# Altium schematic sheet i_sense.SchDoc
size A4; SheetNumber: 5; SheetTotal: 8
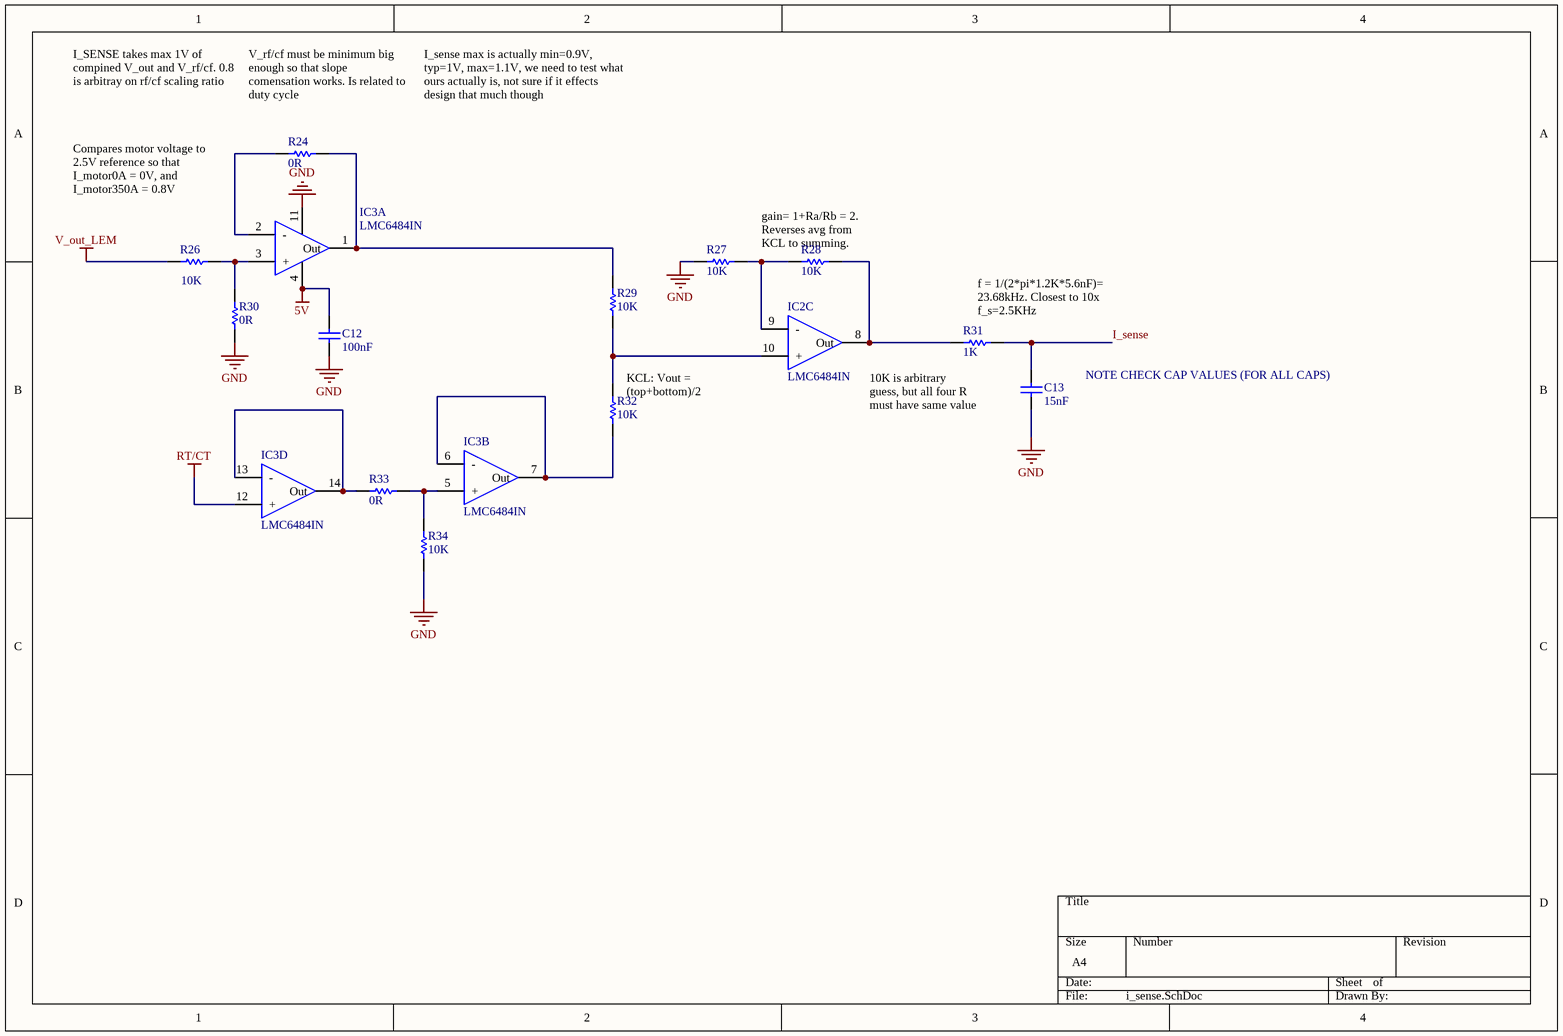
[diagram p0: i_sense.SchDoc]

## Parts
C12  100nF  [CAPC1608L]
C13  15nF  [CAPC1608L]
IC2  LMC6484IN  [DIP794W56P254L1905H533Q14N]  (part C of 4)
IC3  LMC6484IN  [DIP794W56P254L1905H533Q14N]  (parts A,B,D of 4)
R24  0R  [RESC1608L]
R26  10K  [RESC1608L]
R27  10K  [RESC1608L]
R28  10K  [RESC1608L]
R29  10K  [RESC1608L]
R30  0R  [RESC1608L]
R31  1K  [RESC1608L]
R32  10K  [RESC1608L]
R33  0R  [RESC1608L]
R34  10K  [RESC1608L]

## Nets
5V: C12.2 IC3.4(Vcc)
GND: C12.1 C13.1 IC3.11(-Vcc) R27.1 R30.1 R34.1
RT/CT: IC3.12(+)
V_out_LEM: R26.1
I_sense: C13.2 R31.2
NetIC2_8: IC2.8(Out) R28.2 R31.1
NetIC2_9: IC2.9(-) R27.2 R28.1
NetIC2_10: IC2.10(+) R29.1 R32.2
NetIC3_1: IC3.1(Out) R24.2 R29.2
NetIC3_2: IC3.2(-) R24.1
NetIC3_3: IC3.3(+) R26.2 R30.2
NetIC3_5: IC3.5(+) R33.2 R34.2
NetIC3_6: IC3.6(-) IC3.7(Out) R32.1
NetIC3_13: IC3.13(-) IC3.14(Out) R33.1

## Notes on the sheet
- I_SENSE takes max 1V of compined V_out and V_rf/cf. 0.8 is arbitray on rf/cf scaling ratio
- (near R24) V_rf/cf must be minimum big enough so that slope comensation works. Is related to duty cycle
- I_sense max is actually min=0.9V, typ=1V, max=1.1V, we need to test what ours actually is, not sure if it effects design that much though
- Compares motor voltage to 2.5V reference so that I_motor0A = 0V, and I_motor350A = 0.8V
- (near R28) gain= 1+Ra/Rb = 2. Reverses avg from KCL to summing.
- (near R31) f = 1/(2*pi*1.2K*5.6nF)= 23.68kHz. Closest to 10x f_s=2.5KHz
- NOTE CHECK CAP VALUES (FOR ALL CAPS)
- (near R32) KCL: Vout = (top+bottom)/2
- 10K is arbitrary guess, but all four R must have same value

## Library data of the parts
C12 = CC_100nF_0603: CAP CER 100nF X7R +-10% 50V 0603; PackageReference: 0603; Code_IPC: 1608 [0603]; Verify: *; Supplier: ECE Dept; Storage Location: PCB Assembly WS; Value: 100nF
C13 = CC_15nF_0603: CAP CER 15nF X7R +-10% 50V 0603; PackageReference: 0603; Code_IPC: 1608 [0603]; Verify: *; Supplier: ECE Dept; Storage Location: PCB Assembly WS; Value: 15nF
IC2 IC3 = LMC6484IN: Integrated Circuit; Manufacturer_Name: Texas Instruments; Datasheet Link: http://www.ti.com/lit/gpn/lmc6484; Height: 5.334mm; Manufacturer_Part_Number: LMC6484IN; Arrow Part Number: LMC6484IN; Mouser Part Number: 926-LMC6484IN; Mouser Price/Stock: https://www.mouser.com/Search/Refine.aspx?Keyword=926-LMC6484IN
R24 R30 R33 = RS_0R0: RES 0.0 OHM 1/10W 5% 0603 SMD; Storage Location: PCB Assembly WS; Supplier: ECE Dept; Value: 0R
R26-R29 R32 R34 = RS_10K: RES 10.0K OHM 1/10W 5% 0603 SMD; Storage Location: PCB Assembly WS; Supplier: ECE Dept; Value: 10K
R31 = RS_1K: RES 1.0K OHM 1/10W 5% 0603 SMD; Storage Location: PCB Assembly WS; Supplier: ECE Dept; Value: 1K